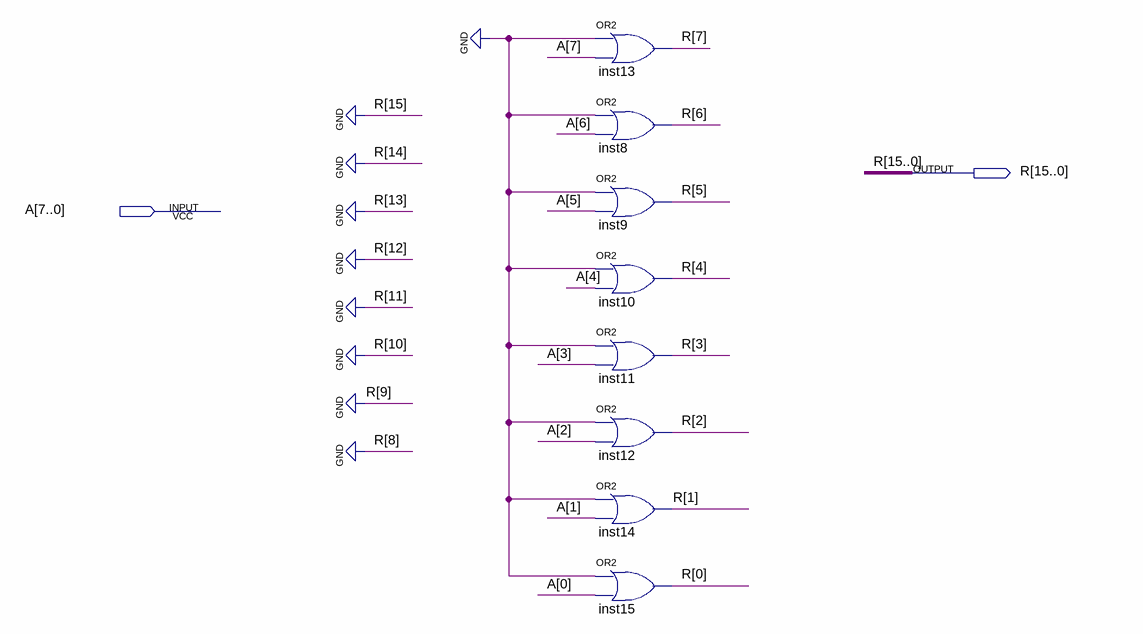
[diagram p0: schematic sheet]
// Quartus schematic R.bdf as structural Verilog: 8 symbols, 2 pins
module R (
  input  [7:0] A,
  output [15:0] R
);

  or inst13 (R[7], 1'b0, A[7]);
  or inst8 (R[6], 1'b0, A[6]);
  or inst9 (R[5], 1'b0, A[5]);
  or inst10 (R[4], 1'b0, A[4]);
  or inst11 (R[3], 1'b0, A[3]);
  or inst12 (R[2], 1'b0, A[2]);
  or inst14 (R[1], 1'b0, A[1]);
  or inst15 (R[0], 1'b0, A[0]);

  assign R[15:8] = {8{1'b0}};
endmodule
